# Altium project MISKO.PrjPCB
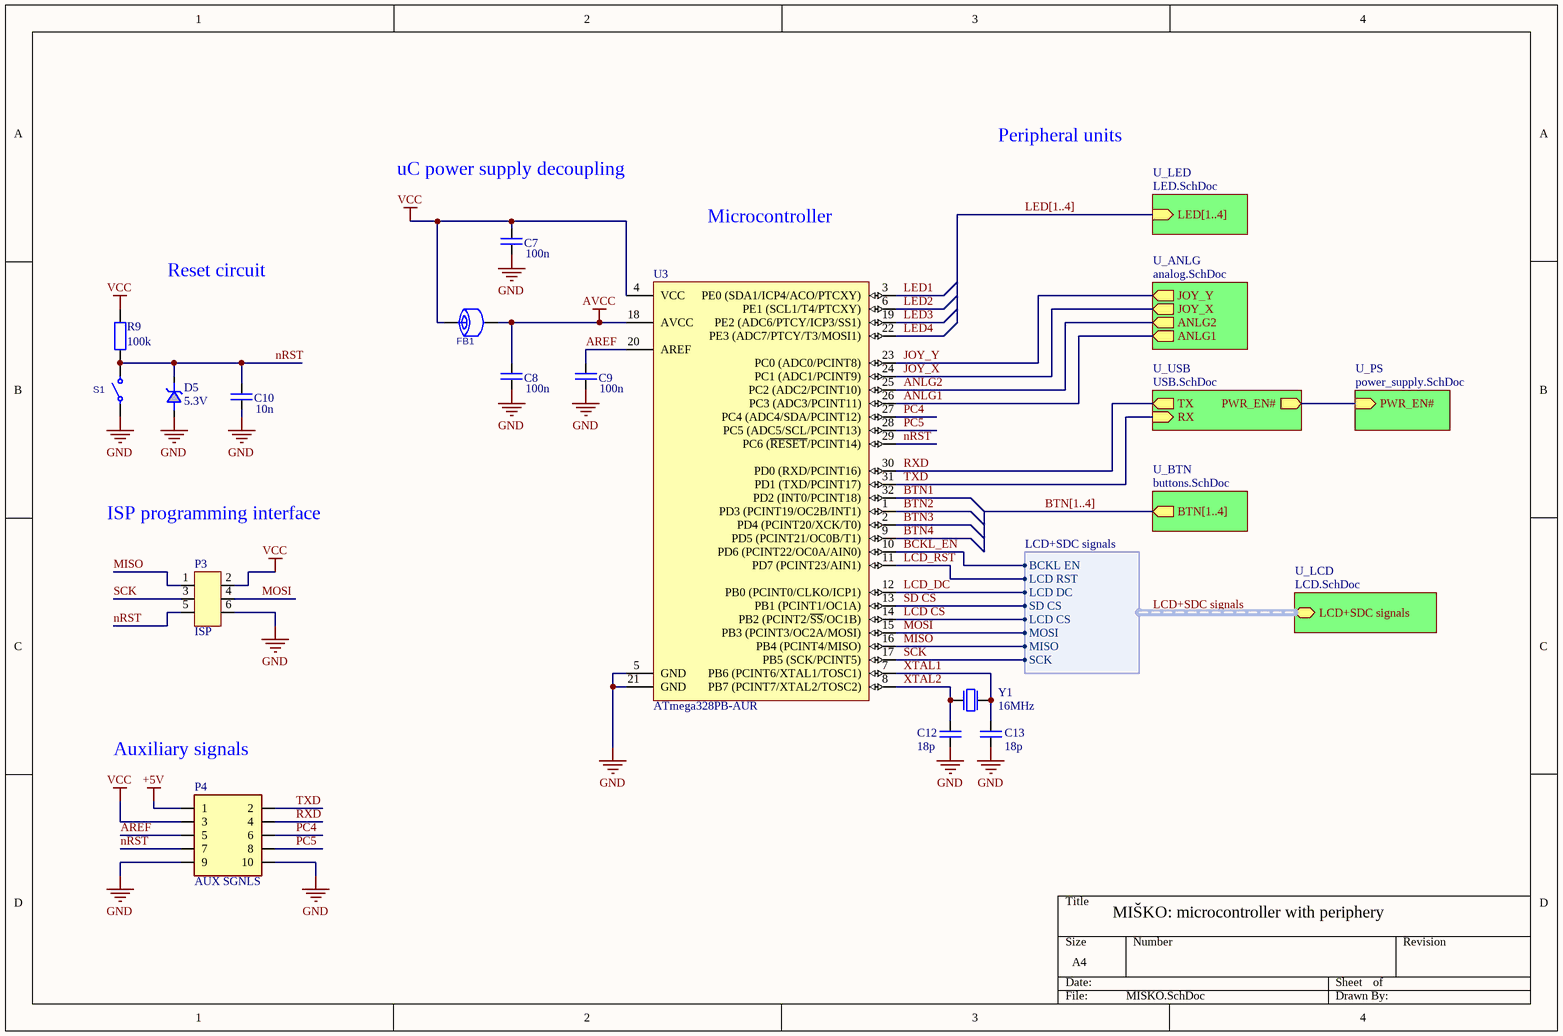
[diagram p0: MISKO.SchDoc]
7 sheets, 98 parts. Net scope: hierarchical (ports join the sheet entries above them; power ports are global).
Board file: MISKO.PcbDoc
Sheets:
  MISKO.SchDoc
    U_USB = USB.SchDoc
    U_ANLG = analog.SchDoc
    U_PS = power_supply.SchDoc
    U_LED = LED.SchDoc
    U_BTN = buttons.SchDoc
    U_LCD = LCD.SchDoc

## Sheet MISKO.SchDoc
size A4

### Parts
C7  value 100n  [C_0805]  (hidden comment: comment)
C8  value 100n  [C_0805]  (hidden comment: comment)
C9  value 100n  [C_0805]  (hidden comment: comment)
C10  value 10n  [C_0805]  (hidden comment: comment)
C12  value 18p  [C_0805]  (hidden comment: comment)
C13  value 18p  [C_0805]  (hidden comment: comment)
D5  5.3V  [SOD-523]
FB1  value  [SMD_0805]  (value not drawn)
P3  ISP  [HEADER 2X3 SHROUDED]
P4  AUX SGNLS  [HEADER SMD 2X5 100 MILS]
R9  value 100k  [R_0805]  (hidden comment: comment)
S1  (no value)  [PUSH BUTTON 6x6 mm]
U3  ATmega328PB-AUR  [32A_N]
Y1  16MHz  [TXC 7a QUARTZ CRYSTAL]

### Sub-sheets
U_ANLG = analog.SchDoc: JOY_Y (out), JOY_X (out), ANLG2 (out), ANLG1 (out)
U_BTN = buttons.SchDoc: BTN[1..4] (out)
U_LCD = LCD.SchDoc: LCD+SDC signals (bidir, harness LCD+SDC signals)
U_LED = LED.SchDoc: LED[1..4] (in)
U_PS = power_supply.SchDoc: PWR_EN# (in)
U_USB = USB.SchDoc: TX (out), RX (in), PWR_EN# (out)

### Harnesses
LCD+SDC signals: BCKL EN, LCD RST, LCD DC, SD CS, LCD CS, MOSI, MISO, SCK

### Nets
+5V: P4.1
AVCC: C8.1 FB1.2 U3.18(AVCC)
GND: C7.2 C8.2 C9.2 C10.2 C12.2 C13.2 D5.A P3.6 P4.9 P4.10 S1.1 U3.5(GND) U3.21(GND)
VCC: C7.1 FB1.1 P3.2 P4.3 R9.1 U3.4(VCC)
ANLG1: U3.26(PC3_(ADC3/PCINT11)) ; sheet U_ANLG/ANLG1
ANLG2: U3.25(PC2_(ADC2/PCINT10)) ; sheet U_ANLG/ANLG2
AREF: C9.1 P4.5 U3.20(AREF)
BCKL_EN: U3.10(PD6_(PCINT22/OC0A/AIN0)) ; sheet U_LCD/LCD+SDC signals.BCKL EN
BTN1: U3.32(PD2_(INT0/PCINT18))
BTN2: U3.1(PD3_(PCINT19/OC2B/INT1))
BTN3: U3.2(PD4_(PCINT20/XCK/T0))
BTN4: U3.9(PD5_(PCINT21/OC0B/T1))
JOY_X: U3.24(PC1_(ADC1/PCINT9)) ; sheet U_ANLG/JOY_X
JOY_Y: U3.23(PC0_(ADC0/PCINT8)) ; sheet U_ANLG/JOY_Y
LCD CS: U3.14(PB2_(PCINT2/~{SS}/OC1B)) ; sheet U_LCD/LCD+SDC signals.LCD CS
LCD_DC: U3.12(PB0_(PCINT0/CLKO/ICP1)) ; sheet U_LCD/LCD+SDC signals.LCD DC  [project net LCD+SDC signals.LCD DC]
LCD_RST: U3.11(PD7_(PCINT23/AIN1)) ; sheet U_LCD/LCD+SDC signals.LCD RST  [project net LCD+SDC signals.LCD RST]
LED1: U3.3(PE0_(SDA1/ICP4/ACO/PTCXY))
LED2: U3.6(PE1_(SCL1/T4/PTCXY))
LED3: U3.19(PE2_(ADC6/PTCY/ICP3/SS1))
LED4: U3.22(PE3_(ADC7/PTCY/T3/MOSI1))
MISO: P3.1 U3.16(PB4_(PCINT4/MISO)) ; sheet U_LCD/LCD+SDC signals.MISO  [project net LCD+SDC signals.MISO]
MOSI: P3.4 U3.15(PB3_(PCINT3/OC2A/MOSI)) ; sheet U_LCD/LCD+SDC signals.MOSI  [project net LCD+SDC signals.MOSI]
nRST: C10.1 D5.C P3.5 P4.7 R9.2 S1.2 U3.29(PC6_(~{RESET}/PCINT14))
PC4: P4.6 U3.27(PC4_(ADC4/SDA/PCINT12))
PC5: P4.8 U3.28(PC5_(ADC5/SCL/PCINT13))
PWR_EN#: sheet U_USB/PWR_EN#, sheet U_PS/PWR_EN#
RXD: P4.4 U3.30(PD0_(RXD/PCINT16)) ; sheet U_USB/TX
SCK: P3.3 U3.17(PB5_(SCK/PCINT5)) ; sheet U_LCD/LCD+SDC signals.SCK  [project net LCD+SDC signals.SCK]
SD CS: U3.13(PB1_(PCINT1/OC1A)) ; sheet U_LCD/LCD+SDC signals.SD CS  [project net LCD+SDC signals.SD CS]
TXD: P4.2 U3.31(PD1_(TXD/PCINT17)) ; sheet U_USB/RX
XTAL1: C13.1 U3.7(PB6_(PCINT6/XTAL1/TOSC1)) Y1.2
XTAL2: C12.1 U3.8(PB7_(PCINT7/XTAL2/TOSC2)) Y1.1

### Buses and harness runs
bus BTN[1..4] = sheet U_BTN/BTN[1..4]
bus LED[1..4] = sheet U_LED/LED[1..4]
harness LCD+SDC signals = sheet U_LCD/LCD+SDC signals

### Notes on the sheet
- uC power supply decoupling
- Peripheral units
- Microcontroller
- Reset circuit
- ISP programming interface
- (near P4) Auxiliary signals
- MIŠKO: microcontroller with periphery

### Library data of the parts
C7-C10 C12 C13 = Capacitor: Generic capacitor
D5 = ESD7371XV2T1G: ESD Protection Device, 20 V, SOD-523, 2 Pins, 5.3 V, 300 mW, ESD7371 Series; HelpURL: https://www.farnell.com/datasheets/2907082.pdf; Manufacturer part number: ESD7371XV2T1G
FB1 = Ferrite bead: Generic ferrite bead; Value: value
P3 = Pin header 2x3 shrouded: Generic shrouded pin header, 2x3, male
P4 = M20-8760542P: Pin Header, Vertical, Wire-to-Board, 2.54 mm, 2 Rows, 10 Contacts, Surface Mount Straight, M20-87; Manufacturer_Name: Harwin; Datasheet Link: https://cdn.harwin.com/pdfs/M20-876P.pdf; Manufacturer_Part_Number: M20-8760542P; Mouser Part Number: 855-M20-8760542P; Mouser Price/Stock: https://www.mouser.co.uk/ProductDetail/Harwin/M20-8760542P?qs=vF78I%252BjhbY%252B9gKdT9lbnBA%3D%3D
R9 = Resistor: Generic resistor
S1 = Push button: Generic push button; Value: *
U3 = ATmega328PB-AUR: 8-bit AVR Microcontroller, 32KB Flash, 1KB EEPROM, 2KB SRAM, 32-pin TQFP, Industrial Grade (-40°C to 85°C), Reel; HelpURL: http://ww1.microchip.com/downloads/en/DeviceDoc/40001907A.pdf; Manufacturer part number: ATmega328PB-AUR
Y1 = 7A-16.000MAAJ-T: Crystal, 16 MHz, SMD, 5mm x 3.2mm, 30 ppm, 18 pF, 30 ppm, 7A Series; Manufacturer: TCX; Dealer number: 1841946; Dealer: Farnell; Load capacitance: 18pF; Frequency tolerance: 30ppm; Category: Crystals; Price: 0.91; Manufacturer Number: 7A-16.000MAAJ-T; Value: 16MHz; Technology: SMT; Case: 5X3.2; HelpURL: https://www.farnell.com/datasheets/1041607.pdf

## Sheet USB.SchDoc
size A4
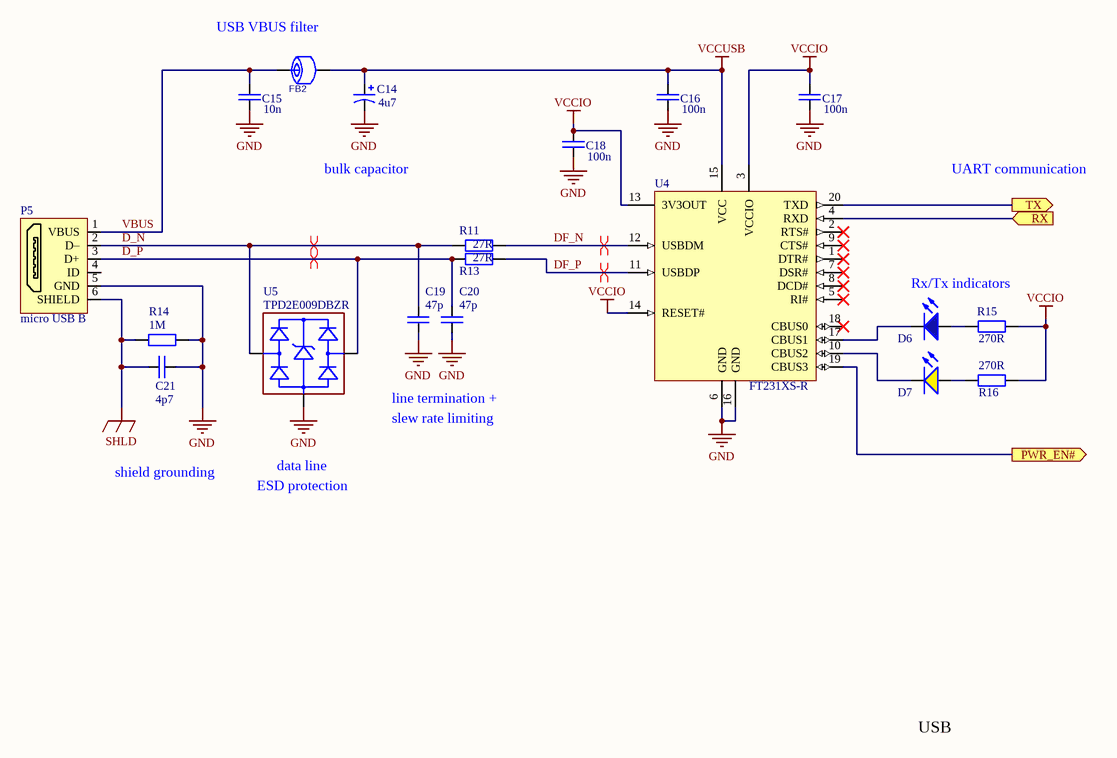
[diagram p1: USB.SchDoc]

### Parts
C14  value 4u7  [Tantalum Case A]  (hidden comment: comment)
C15  value 10n  [C_0805]  (hidden comment: comment)
C16  value 100n  [C_0805]  (hidden comment: comment)
C17  value 100n  [C_0805]  (hidden comment: comment)
C18  value 100n  [C_0805]  (hidden comment: comment)
C19  value 47p  [C_0805]  (hidden comment: comment)
C20  value 47p  [C_0805]  (hidden comment: comment)
C21  value 4p7  [C_0805]  (hidden comment: comment)
D6  comment  [LED_0805]  (value not drawn)
D7  LED Yellow  [LED_0805]  (value not drawn)
FB2  value  [SMD_0805]  (value not drawn)
P5  micro USB B  [micro-USB-HRS-ZX62D-B-5PA8]
R11  value 27R  [R_0805]  (hidden comment: comment)
R13  value 27R  [R_0805]  (hidden comment: comment)
R14  value 1M  [R_0805]  (hidden comment: comment)
R15  value 270R  [R_0805]  (hidden comment: comment)
R16  value 270R  [R_0805]  (hidden comment: comment)
U4  FT231XS-R  [SSOP-20]
U5  TPD2E009DBZR  [SOT23-3]

### Ports
PWR_EN# (out), RX (in), TX (out)

### Nets
GND: C14.2 C15.2 C16.2 C17.2 C18.2 C19.2 C20.2 C21.2 P5.5(GND) R14.1 U4.6(GND) U4.16(GND) U5.3(GND)
SHLD: C21.1 P5.6(SHIELD) R14.2
VCCIO: C17.1 C18.1 R15.2 R16.2 U4.3(VCCIO) U4.13(3V3OUT) U4.14(RESET#)
VCCUSB: C14.1 C16.1 FB2.2 U4.15(VCC)
D_N: C19.1 P5.2(D–) R11.1 U5.2(D-)
D_P: C20.1 P5.3(D+) R13.1 U5.1(D+)
DF_N: R11.2 U4.12(USBDM)
DF_P: R13.2 U4.11(USBDP)
PWR_EN#: U4.19(CBUS3) ; port PWR_EN#
RXD: U4.20(TXD) ; port TX
TXD: U4.4(RXD) ; port RX
VBUS: C15.1 FB2.1 P5.1(VBUS)
NetD6_1: D6.1(-) U4.17(CBUS1)
NetD6_2: D6.2(+) R15.1
NetD7_1: D7.1(-) U4.10(CBUS2)
NetD7_2: D7.2(+) R16.1

Not connected (* = marked no-connect by the designer): P5 4(ID); U4 1(DTR#)* 2(RTS#)* 5(RI#)* 7(DSR#)* 8(DCD#)* 9(CTS#)* 18(CBUS0)*

### Layout directives
differential pair: D_N, D_P, DF_N, DF_P

### Notes on the sheet
- (near FB2) USB VBUS filter
- bulk capacitor
- UART communication
- Rx/Tx indicators
- data line
- line termination +
- (near U5) slew rate limiting
- shield grounding
- ESD protection
- USB

### Library data of the parts
C14 = Capacitor - polarized: Generic polarized capacitor
C15-C21 = Capacitor: Generic capacitor
D6 = LED Blue
FB2 = Ferrite bead: Generic ferrite bead; Value: value
P5 = ZX62D-B-5PA8(30): USB Connector, Micro USB Type B, USB 2.0, Receptacle, 5 Ways, Surface Mount, Through Hole Mount; pin to pad: 6>0; Manufacturer: Hirose; Supplier 1: Farnell; ComponentLink1URL: http://www.farnell.com/datasheets/1693470.pdf; ComponentLink1Description: http://www.farnell.com/datasheets/1693470.pdf; Supplier Part Number 1: 2300438; HelpURL: https://www.farnell.com/datasheets/2691174.pdf; Manufacturer part number: ZX62D-B-5PA8(30)
R11 R13-R16 = Resistor: Generic resistor
U4 = FT231XS-R: USB to Full-Handshake UART Interface Chip, UHCI/OHCI/EHCI Compatible, USB 2.0 Compatible, -40 to +85 degC, 20-Pin SSOP, Pb-Free, Tape and Reel; Manufacturer: FTDI; DatasheetVersion: ver 1.2, Feb-2013; PackageVersion: Feb-13; PackageReference: SSOP-20; PackageDescription: 20-Pin Small Outline Package, 8.6 x 3.9 mm Body, 0.635 mm Pitch; Code_JEDEC: MO-137-AD; PartNumber: FT231XS-R; ComponentLink1Description: Manufacturer URL; ComponentLink1URL: http://www.ftdichip.com/; ComponentLink2Description: Datasheet; ComponentLink2URL: http://www.ftdichip.com/Support/Documents/DataSheets/ICs/DS_FT231X.pdf; ComponentLink3Description: FT231X Product Page; ComponentLink3URL: www.ftdichip.com/Products/ICs/FT231X.html; HelpURL: https://www.farnell.com/datasheets/1913754.pdf
U5 = TPD2E009DBZR: ESD protection for high-speed interfaces; Manufacturer: Texas Instruments; Dealer number: 595-TPD2E009DBZR; Dealer: Mouser; Category: diode array; Price: 0.174; Manufacturer Number: TPD2E009DBZR; Technology: SMT; HelpURL: http://www.ti.com/general/docs/suppproductinfo.tsp?distId=26&gotoUrl=http%3A%2F%2Fwww.ti.com%2Flit%2Fgpn%2Ftpd2e009

## Sheet analog.SchDoc
size A4
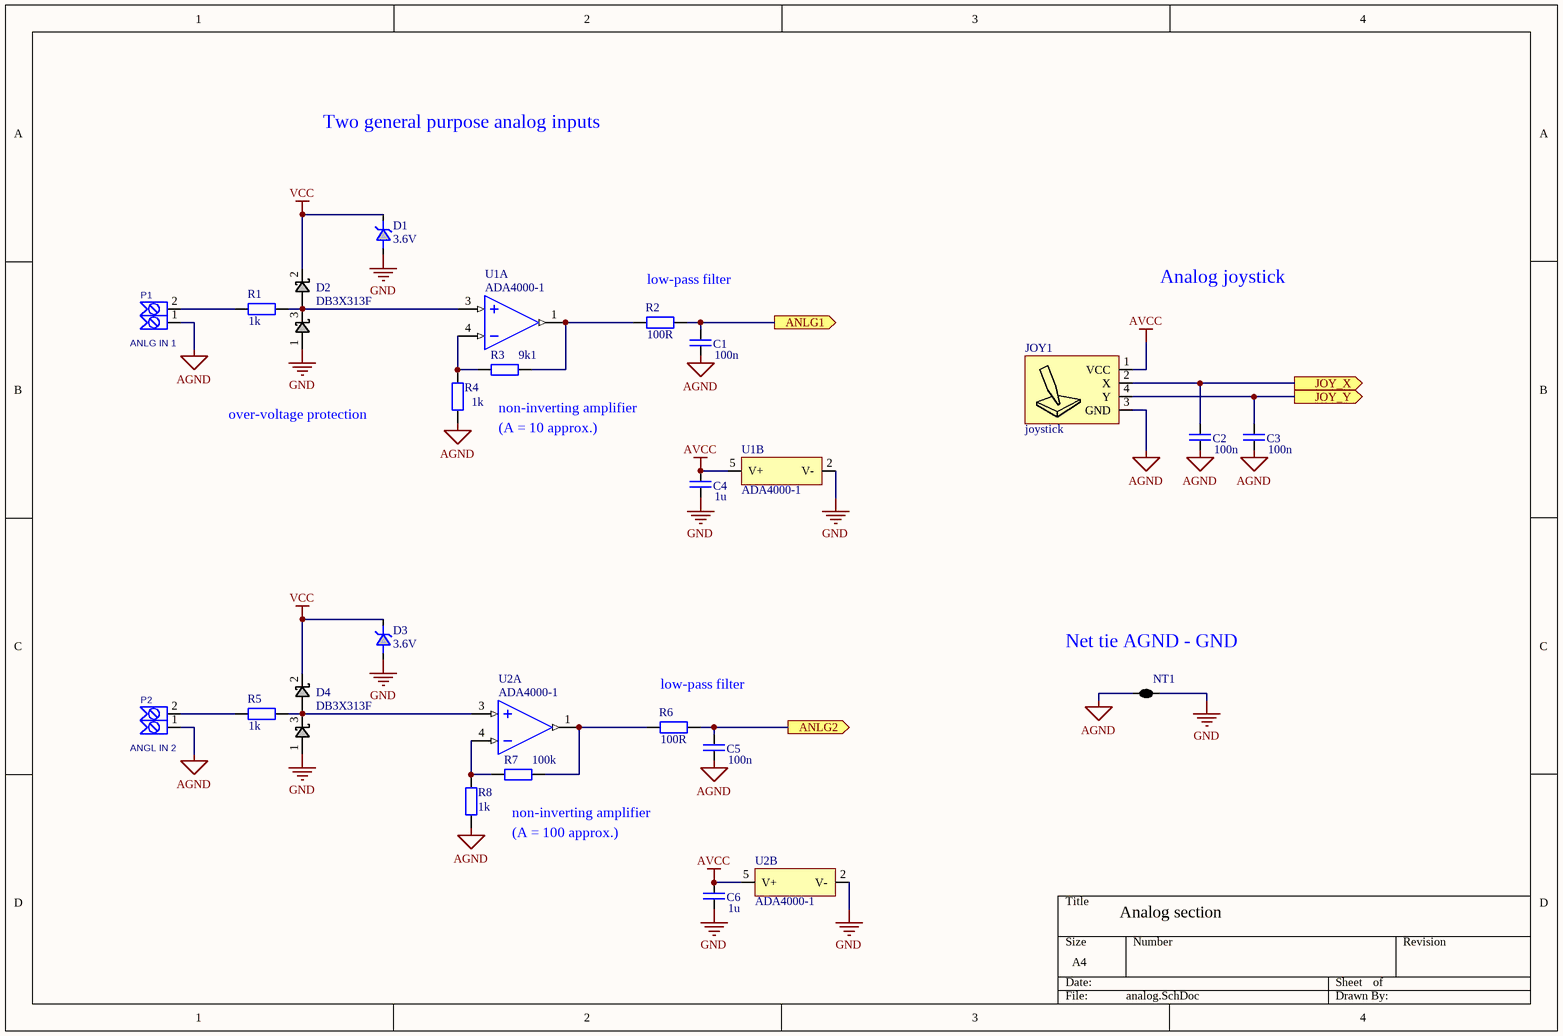
[diagram p2: analog.SchDoc]

### Parts
C1  value 100n  [C_0805]  (hidden comment: comment)
C2  value 100n  [C_0805]  (hidden comment: comment)
C3  value 100n  [C_0805]  (hidden comment: comment)
C4  value 1u  [C_0805]  (hidden comment: comment)
C5  value 100n  [C_0805]  (hidden comment: comment)
C6  value 1u  [C_0805]  (hidden comment: comment)
D1  3.6V  [SOD-123_N]
D2  DB3X313F  [SOT23-3]
D3  3.6V  [SOD-123_N]
D4  DB3X313F  [SOT23-3]
JOY1  joystick  [PSP1000JOY]
NT1  net tie 2-way  [NET TIE 2-way]  (value not drawn)  (net tie, no BOM)
P1  ANLG IN 1  [VRSTNA SPONKA 2P/16A]
P2  ANGL IN 2  [VRSTNA SPONKA 2P/16A]
R1  value 1k  [R_0805]  (hidden comment: comment)
R2  value 100R  [R_0805]  (hidden comment: comment)
R3  value 9k1  [R_0805]  (hidden comment: comment)
R4  value 1k  [R_0805]  (hidden comment: comment)
R5  value 1k  [R_0805]  (hidden comment: comment)
R6  value 100R  [R_0805]  (hidden comment: comment)
R7  value 100k  [R_0805]  (hidden comment: comment)
R8  value 1k  [R_0805]  (hidden comment: comment)
U1  ADA4000-1  [SOT23-5]  (parts A,B of 2)
U2  ADA4000-1  [SOT23-5]  (parts A,B of 2)

### Ports
ANLG1 (out), ANLG2 (out), JOY_X (out), JOY_Y (out)

### Nets
AGND: C1.2 C2.2 C3.2 C5.2 JOY1.3(GND) NT1.1 P1.1 P2.1 R4.1 R8.1
AVCC: C4.1 C6.1 JOY1.1(VCC) U1.5(V+) U2.5(V+)
GND: C4.2 C6.2 D1.A D2.1(A) D3.A D4.1(A) NT1.2 U1.2(V-) U2.2(V-)
VCC: D1.C D2.2(C) D3.C D4.2(C)
ANLG1: C1.1 R2.2 ; port ANLG1
ANLG2: C5.1 R6.2 ; port ANLG2
JOY_X: C2.1 JOY1.2(X) ; port JOY_X
JOY_Y: C3.1 JOY1.4(Y) ; port JOY_Y
NetD2_3: D2.3(AC) R1.2 U1.3(IN+)
NetD4_3: D4.3(AC) R5.2 U2.3(IN+)
NetP1_2: P1.2 R1.1
NetP2_2: P2.2 R5.1
NetR2_1: R2.1 R3.2 U1.1(OUT)
NetR3_1: R3.1 R4.2 U1.4(IN-)
NetR6_1: R6.1 R7.2 U2.1(OUT)
NetR7_1: R7.1 R8.2 U2.4(IN-)

### Notes on the sheet
- Two general purpose analog inputs
- low-pass filter
- Analog joystick
- over-voltage protection
- non-inverting amplifier
- (A = 10 approx.)
- (near NT1) Net tie AGND - GND
- (A = 100 approx.)
- Analog section

### Library data of the parts
C1-C6 = Capacitor: Generic capacitor
D1 D3 = MMSZ5227B: Zener Single Diode, 3.6 V, 500 mW, SOD-123, 5 %, 2 Pins, 150 °C; HelpURL: https://www.farnell.com/datasheets/1670964.pdf; Manufacturer part number: MMSZ5227B
D2 D4 = DB3X313F: Schottky Rectifier, 30 V, 130 mA, Dual Series, SOT-23, 3 Pins, 550 mV; HelpURL: https://www.farnell.com/datasheets/1912091.pdf; Manufacturer part number: DB3X313F
JOY1 = joystick: Analog joystick
P1 P2 = Screw terminal 2P 200mil: Generic screw terminal, 2 poles, 200 mil pitch; Value: *
R1-R8 = Resistor: Generic resistor
U1 U2 = ADA4000-1: Operational Amplifier, Single, 1 Amplifier, 5 MHz, 20 V/µs, ± 4V to ± 18V, TSOT, 5 Pins; Part Number: XOG0003; Manufacturer: Analog devices; Manufacturer Number: ADA4000-1AUJZ-R7; Dealer number: 2461002; Dealer: Farnell; Supply voltage max: +-18V; Devices: 1; Category: Integrated circuits; Price: 1.97; Case: SOT; Technology: SMT; HelpURL: https://www.farnell.com/datasheets/698265.pdf

## Sheet power_supply.SchDoc
size A4
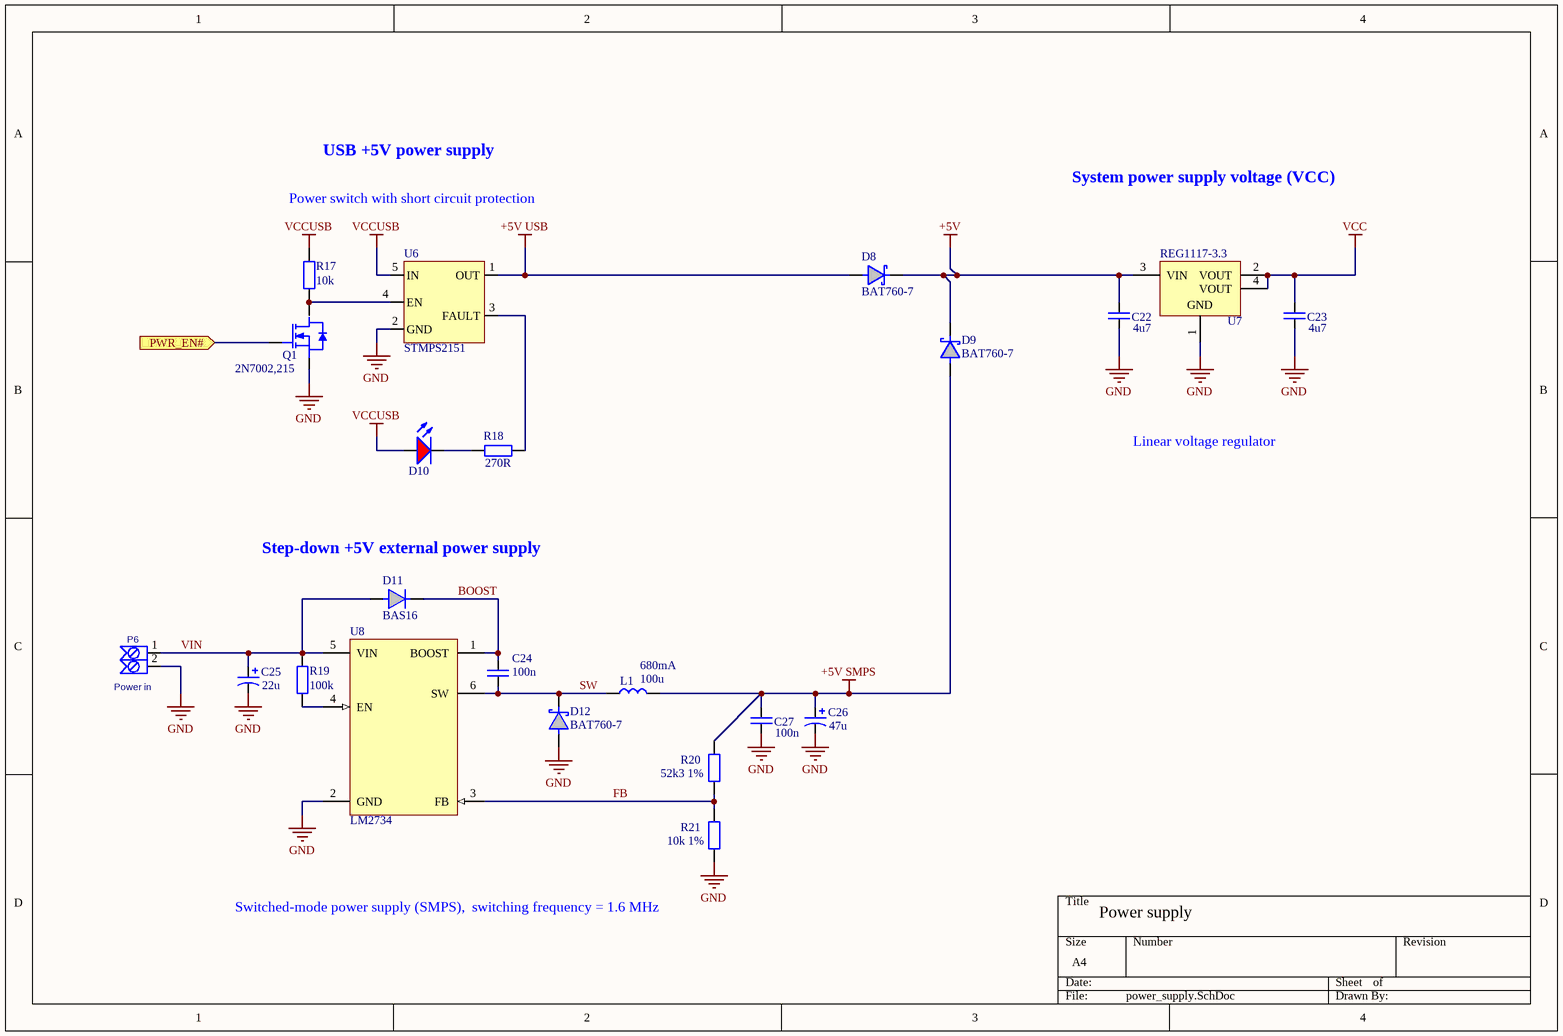
[diagram p3: power_supply.SchDoc]

### Parts
C22  value 4u7  [C_0805]  (hidden comment: comment)
C23  value 4u7  [C_0805]  (hidden comment: comment)
C24  value 100n  [C_0805]  (hidden comment: comment)
C25  value 22u  [Tantalum Case A]  (hidden comment: comment)
C26  value 47u  [Tantalum Case A]  (hidden comment: comment)
C27  value 100n  [C_0805]  (hidden comment: comment)
D8  BAT760-7  [SOD-323]
D9  BAT760-7  [SOD-323]
D10  LED Red  [LED_0805]  (value not drawn)
D11  BAS16  [SOT23-3]
D12  BAT760-7  [SOD-323]
L1  680mA  value 100u  [IND_6060_N]
P6  Power in  [VRSTNA SPONKA 2P/16A]
Q1  2N7002,215  [SOT23-3]
R17  value 10k  [R_0805]  (hidden comment: comment)
R18  value 270R  [R_0805]  (hidden comment: comment)
R19  value 100k  [R_0805]  (hidden comment: comment)
R20  value 52k3 1%  [R_0805]  (hidden comment: comment)
R21  value 10k 1%  [R_0805]  (hidden comment: comment)
U6  STMPS2151  [SOT23-5]
U7  REG1117-3.3  [SOT-223-4]
U8  LM2734  [SOT-23-6-THIN]

### Ports
PWR_EN# (in)

### Nets
+5V: C22.1 D8.C D9.C U7.3(VIN)
+5V SMPS: C26.1 C27.1 D9.A L1.2 R20.2
+5V USB: D8.A U6.1(OUT)
GND: C22.2 C23.2 C25.2 C26.2 C27.2 D12.A P6.2 Q1.2(S) R21.1 U6.2(GND) U7.1(GND) U8.2(GND)
VCC: C23.1 U7.2(VOUT) U7.4(VOUT)
VCCUSB: D10.2(+) R17.2 U6.5(IN)
BOOST: C24.1 D11.C U8.1(BOOST)
FB: R20.1 R21.2 U8.3(FB)
PWR_EN#: Q1.1(G) ; port PWR_EN#
SW: C24.2 D12.C L1.1 U8.6(SW)
VIN: C25.1 D11.A P6.1 R19.1 U8.5(VIN)
NetD10_1: D10.1(-) R18.1
NetQ1_3: Q1.3(D) R17.1 U6.4(EN)
NetR18_2: R18.2 U6.3(FAULT)
NetR19_2: R19.2 U8.4(EN)

### Notes on the sheet
- USB +5V power supply
- Power switch with short circuit protection
- System power supply voltage (VCC)
- Linear voltage regulator
- (near D11) Step-down +5V external power supply
- (near R21) Switched-mode power supply (SMPS),  switching frequency = 1.6 MHz
- Power supply

### Library data of the parts
C22-C24 C27 = Capacitor: Generic capacitor
C25 C26 = Capacitor - polarized: Generic polarized capacitor
D8 D9 D12 = BAT760-7: Schottky Rectifier, 30 V, 1 A, Single, SOD-323, 2 Pins, 550 mV
D11 = BAS16: Silicon Switching Diode for High-Speed Switching; pin to pad: A>1 C>3
L1 = SDR0604-101KL: Power Inductor (SMD), 100 µH, 520 mA, Unshielded, 680 mA, SDR0604
P6 = Screw terminal 2P 200mil: as P1 on sheet analog; Value: *
Q1 = 2N7002,215: N-Channel Trench MOSFET, 60 V, 0.3 A, 3-Pin SOT23, Tape and Reel; Manufacturer: NXP Semiconductors; Channel Type: N; Ciss [typ] (pF): 31; Coss [typ] (pF): 6.8; ID [max] (A): 0.3; Packing: Tape & Reel; Qr [typ] (nC): 30; VDS [max] (V): 60; VGSth [typ] (V): 2; DatasheetVersion: Rev. 7; PackageVersion: 06-03-16, 03/2006; PackageReference: SOT23; PackageDescription: 3-Pin Small Outline Transistor Package, Body 2.9 x 1.3 mm, Pitch 0.95 mm; Supplier 1: Digi-Key; Supplier Part Number 1: 568-1369-2-ND; Supplier 2: Digi-Key; Supplier Part Number 2: 568-1369-1-ND; Supplier 3: Digi-Key; Supplier Part Number 3: 568-1369-6-ND; Supplier 4: Farnell; Supplier Part Number 4: 2315576; Supplier 5: Farnell; Supplier Part Number 5: 1510761; Supplier 6: Farnell; Supplier Part Number 6: 1510761RL; Supplier 7: Newark; Supplier Part Number 7: 75R4879; Supplier 8: Newark; Supplier Part Number 8: 70R9742; Supplier 9: Mouser; Supplier Part Number 9: 771-2N7002-T/R; Mounting Technology: Surface Mount; Code_JEDEC: TO-236AB; PartNumber: 2N7002,215; ComponentLink1Description: Manufacturer URL; ComponentLink1URL: http://www.nxp.com/; ComponentLink2Description: Datasheet; ComponentLink2URL: http://www.nxp.com/documents/data_sheet/2N7002.pdf; ComponentLink3Description: Package Specification; ComponentLink3URL: http://www.nxp.com/documents/outline_drawing/sot023_po.pdf; HelpURL: https://www.farnell.com/datasheets/1499179.pdf
R17-R21 = Resistor: Generic resistor
U6 = STMPS2151: Power Load Switch, Single High Side, Active High, 1 Output, 5V, 0.5A, SOT-23-5; Supplier 1: Farnell; Supplier Part Number 1: 1842616; HelpURL: https://www.farnell.com/datasheets/1700527.pdf; Manufacturer part number: STMPS2151
U7 = REG1117-3.3: Single Output LDO, 800 mA, Fixed 3.3 V Output, 3.8 to 15 V Input, with Internal Current Limiting, 4-pin SOT-223 (DCY), -40 to 125 degC, Green (RoHS & no Sb/Br); Manufacturer: Texas Instruments; Fixed Output Options(V): 5; Iout(Max)(A): 0.8; Iq(Typ)(mA): 4; Rating: Catalog; SubFamily: Single Channel LDO; Vdo(Typ)(mV): 1100; Vin(Max)(V): 15; Vin(Min)(V): 3.8; Vout Adj(Max)(V): 3.3; DatasheetVersion: SBVS001D; PackageVersion: 4202506/B; PackageReference: DCY4; PackageDescription: 4-Pin Plastic Small Outline, Body 3.5 x 6.5 mm, Pitch 2.3 mm; Supplier 1: Digi-Key; Supplier Part Number 1: REG1117-3.3-ND; Supplier 2: Farnell; Supplier Part Number 2: 1212355; Supplier 3: Farnell; Supplier Part Number 3: 2126471; Supplier 4: Newark; Supplier Part Number 4: 35C1963; Supplier 5: Mouser; Supplier Part Number 5: 595-REG1117-3.3; Eco-Plan: Green (RoHS & no Sb/Br); Vout Adj(Min)(V): 3.3; Mounting Technology: Surface Mount; Code_JEDEC: TO-261; PartNumber: REG1117-3.3; ComponentLink1Description: Manufacturer URL; ComponentLink1URL: http://www.ti.com/; ComponentLink2Description: Datasheet; ComponentLink2URL: http://www.ti.com/general/docs/lit/getliterature.tsp?genericPartNumber=REG1117-33&fileType=pdf; ComponentLink3Description: Package Specification; ComponentLink3URL: http://www.ti.com/litv/pdf/mpds094a; HelpURL: http://www.ti.com/general/docs/suppproductinfo.tsp?distId=26&gotoUrl=http%3A%2F%2Fwww.ti.com%2Flit%2Fgpn%2FREG1117
U8 = LM2734: Thin SOT23 1A Load Step-Down DC-DC Regulator; PartNumber: LM2734XMK; Manufacturer: National Semiconductor; CompType: Switcher; PackageTopMarking: SFDB*XTT; PowerWise: N; FirstPublished: 4-Dec-2008; DatasheetVersion: Jun-2008; PackageVersion: revD, Jul-2005; PackageReference: MK06A; Publisher: Altium Limited; PackageDescription: Molded TSOT, 2.97 x 1.65 x 0.87mm Body, 6 Lead, 0.95mm Pitch; RoHS: Y; PinCount: 6; DigiKeyPartNumber: LM2734XMKCT-ND; Code_JEDEC: MO-193-AA; Code_IPC: SOT26A-6; ComponentLink1Description: LM2734 Datasheet; ComponentLink1URL: http://www.national.com/ds/LM/LM2734.pdf; ComponentLink2Description: LM2734 Web Page; ComponentLink2URL: http://www.national.com/pf/LM/LM2734.html; ComponentLink3Description: MK06A Package Page; ComponentLink3URL: http://www.national.com/packaging/folders/mk06a.html; Supplier 1: Farnell; Supplier 2: Farnell; HelpURL: https://www.ti.com/lit/ds/symlink/lm2734.pdf

## Sheet LED.SchDoc
size A4
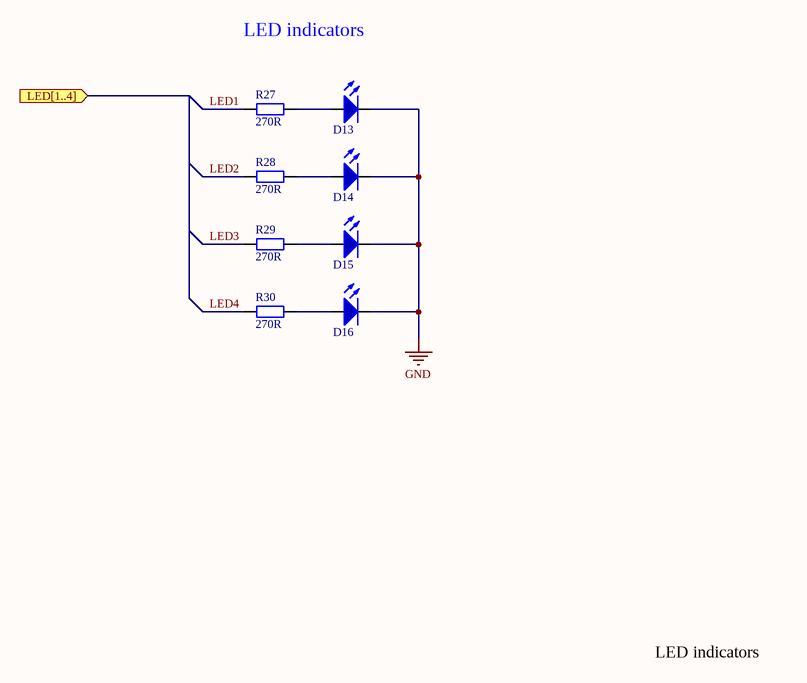
[diagram p4: LED.SchDoc]

### Parts
D13  LED Blue  [LED_0805]  (value not drawn)
D14  LED Blue  [LED_0805]  (value not drawn)
D15  LED Blue  [LED_0805]  (value not drawn)
D16  LED Blue  [LED_0805]  (value not drawn)
R27  270R  [R_0805]
R28  270R  [R_0805]
R29  270R  [R_0805]
R30  270R  [R_0805]

### Ports
LED[1..4] (in)

### Nets
GND: D13.1(-) D14.1(-) D15.1(-) D16.1(-)
LED1: R27.2
LED2: R28.2
LED3: R29.2
LED4: R30.2
NetD13_2: D13.2(+) R27.1
NetD14_2: D14.2(+) R28.1
NetD15_2: D15.2(+) R29.1
NetD16_2: D16.2(+) R30.1

### Notes on the sheet
- LED indicators

### Library data of the parts
R27-R30 = Resistor: Generic resistor; Value: 270R

## Sheet buttons.SchDoc
size A4
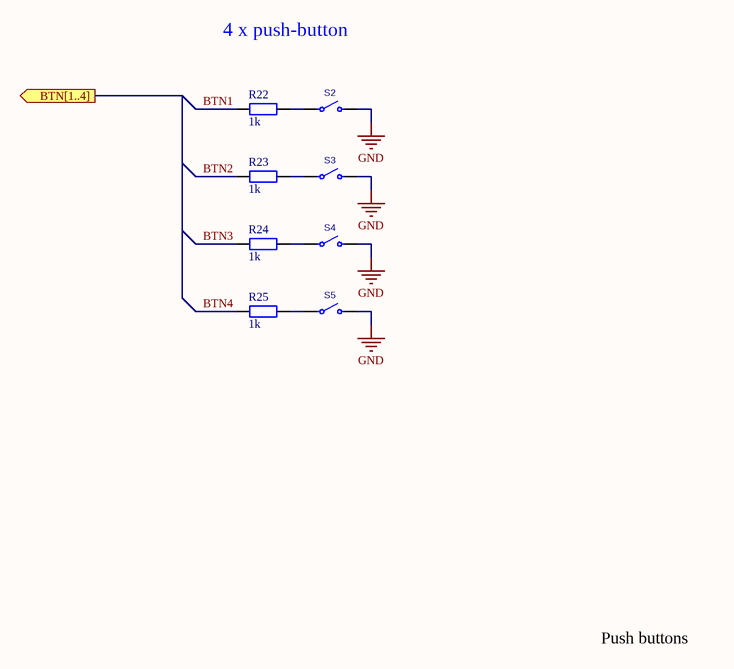
[diagram p5: buttons.SchDoc]

### Parts
R22  1k  [R_0805]
R23  1k  [R_0805]
R24  1k  [R_0805]
R25  1k  [R_0805]
S2  (no value)  [PUSH BUTTON 6x6 mm]
S3  (no value)  [PUSH BUTTON 6x6 mm]
S4  (no value)  [PUSH BUTTON 6x6 mm]
S5  (no value)  [PUSH BUTTON 6x6 mm]

### Ports
BTN[1..4] (out)

### Nets
GND: S2.2 S3.2 S4.2 S5.2
BTN1: R22.1
BTN2: R23.1
BTN3: R24.1
BTN4: R25.1
NetR22_2: R22.2 S2.1
NetR23_2: R23.2 S3.1
NetR24_2: R24.2 S4.1
NetR25_2: R25.2 S5.1

### Notes on the sheet
- 4 x push-button
- Push buttons

### Library data of the parts
R22-R25 = Resistor: Generic resistor; Value: 1k
S2-S5 = Push button: Generic push button

## Sheet LCD.SchDoc
size A4
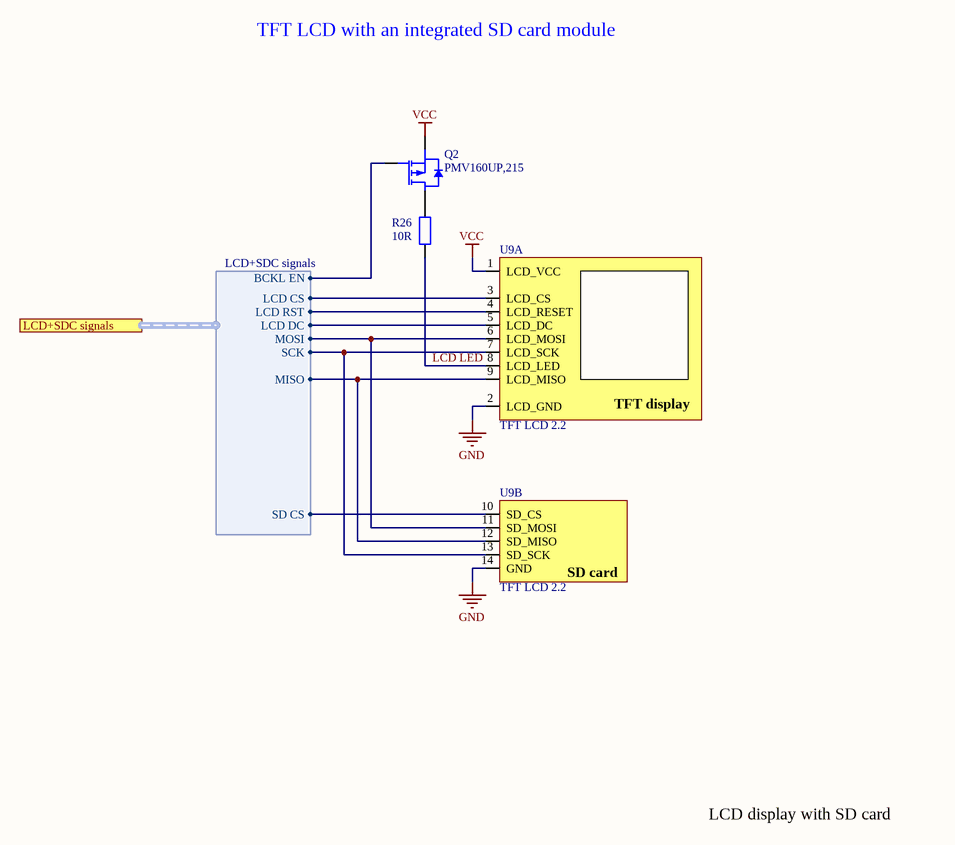
[diagram p6: LCD.SchDoc]

### Parts
Q2  PMV160UP,215  [SOT23-3]
R26  10R  [R_0805]
U9  TFT LCD 2.2  [LCD tft 2.2]  (parts A,B of 2)

### Ports
LCD+SDC signals (harness LCD+SDC signals)

### Harnesses
LCD+SDC signals: BCKL EN, LCD CS, LCD DC, LCD RST, MISO, MOSI, SCK, SD CS

### Nets
GND: U9.2(LCD_GND) U9.14(GND)
VCC: Q2.2(S) U9.1(LCD_VCC)
BCKL_EN: Q2.1(G) ; port LCD+SDC signals.BCKL EN
LCD CS: U9.3(LCD_CS) ; port LCD+SDC signals.LCD CS
LCD LED: R26.1 U9.8(LCD_LED)
LCD+SDC signals.LCD DC: U9.5(LCD_DC) ; port LCD+SDC signals.LCD DC
LCD+SDC signals.LCD RST: U9.4(LCD_RESET) ; port LCD+SDC signals.LCD RST
LCD+SDC signals.MISO: U9.9(LCD_MISO) U9.12(SD_MISO) ; port LCD+SDC signals.MISO
LCD+SDC signals.MOSI: U9.6(LCD_MOSI) U9.11(SD_MOSI) ; port LCD+SDC signals.MOSI
LCD+SDC signals.SCK: U9.7(LCD_SCK) U9.13(SD_SCK) ; port LCD+SDC signals.SCK
LCD+SDC signals.SD CS: U9.10(SD_CS) ; port LCD+SDC signals.SD CS
NetQ2_3: Q2.3(D) R26.2

### Notes on the sheet
- TFT LCD with an integrated SD card module
- LCD display with SD card
- (in symbol TFT LCD 2.2, part A) TFT display
- (in symbol TFT LCD 2.2, part B) SD card

### Library data of the parts
Q2 = PMV160UP,215: P-Channel Trench MOSFET, -20 V, -1.2 A, -55 to 150 degC, 3-Pin SOT23, Tape and Reel; Manufacturer: NXP Semiconductors; Channel Type: P; Ciss [typ] (pF): 365; Coss [typ] (pF): 42; Packing: Tape & Reel; VGSth [typ] (V): -0.7; DatasheetVersion: Rev. 2; PackageVersion: 06-03-16, 03/2006; PackageReference: SOT23; PackageDescription: 3-Pin Small Outline Transistor Package, Body 2.9 x 1.3 mm, Pitch 0.95 mm; Supplier 1: Digi-Key; Supplier Part Number 1: 568-10320-2-ND; Supplier 2: Digi-Key; Supplier Part Number 2: 568-10320-1-ND; Supplier 3: Digi-Key; Supplier Part Number 3: 568-10320-6-ND; Supplier 4: Newark; Supplier Part Number 4: 54T9404; Supplier 5: Mouser; Supplier Part Number 5: 771-PMV160UP215; ID [max] (A): -1.2; VDS [max] (V): -20; Mounting Technology: Surface Mount; Code_JEDEC: TO-236AB; PartNumber: PMV160UP,215; ComponentLink1Description: Manufacturer URL; ComponentLink1URL: http://www.nxp.com/; ComponentLink2Description: Datasheet; ComponentLink2URL: http://www.nxp.com/documents/data_sheet/PMV160UP.pdf; ComponentLink3Description: Package Specification; ComponentLink3URL: http://www.nxp.com/documents/outline_drawing/sot023_po.pdf; HelpURL: https://eu.mouser.com/datasheet/2/916/PMV160UP-1600107.pdf
R26 = Resistor: Generic resistor; Value: 10R
U9 = TFT LCD 2.2: LCD 320x240, 65536 color, ILI3941

## Nets that join several sheets
+5V: MISKO (P4.1), power_supply (C22.1 D8.C D9.C U7.3)
AVCC: MISKO (C8.1 FB1.2 U3.18), analog (5 pins)
GND: MISKO (13 pins), USB (13 pins), analog (9 pins), power_supply (12 pins), LED (D13.1 D14.1 D15.1 D16.1), buttons (S2.2 S3.2 S4.2 S5.2), LCD (U9.2 U9.14)
VCC: MISKO (6 pins), analog (D1.C D2.2 D3.C D4.2), power_supply (C23.1 U7.2 U7.4), LCD (Q2.2 U9.1)
VCCUSB: USB (C14.1 C16.1 FB2.2 U4.15), power_supply (D10.2 R17.2 U6.5)
ANLG1: MISKO (U3.26), analog (C1.1 R2.2)
ANLG2: MISKO (U3.25), analog (C5.1 R6.2)
BCKL_EN: MISKO (U3.10), LCD (Q2.1)
JOY_X: MISKO (U3.24), analog (C2.1 JOY1.2)
JOY_Y: MISKO (U3.23), analog (C3.1 JOY1.4)
LCD CS: MISKO (U3.14), LCD (U9.3)
LCD+SDC signals.LCD DC: MISKO (U3.12), LCD (U9.5)
LCD+SDC signals.LCD RST: MISKO (U3.11), LCD (U9.4)
LCD+SDC signals.MISO: MISKO (P3.1 U3.16), LCD (U9.9 U9.12)
LCD+SDC signals.MOSI: MISKO (P3.4 U3.15), LCD (U9.6 U9.11)
LCD+SDC signals.SCK: MISKO (P3.3 U3.17), LCD (U9.7 U9.13)
LCD+SDC signals.SD CS: MISKO (U3.13), LCD (U9.10)
PWR_EN#: USB (U4.19), power_supply (Q1.1)
RXD: MISKO (P4.4 U3.30), USB (U4.20)
TXD: MISKO (P4.2 U3.31), USB (U4.4)